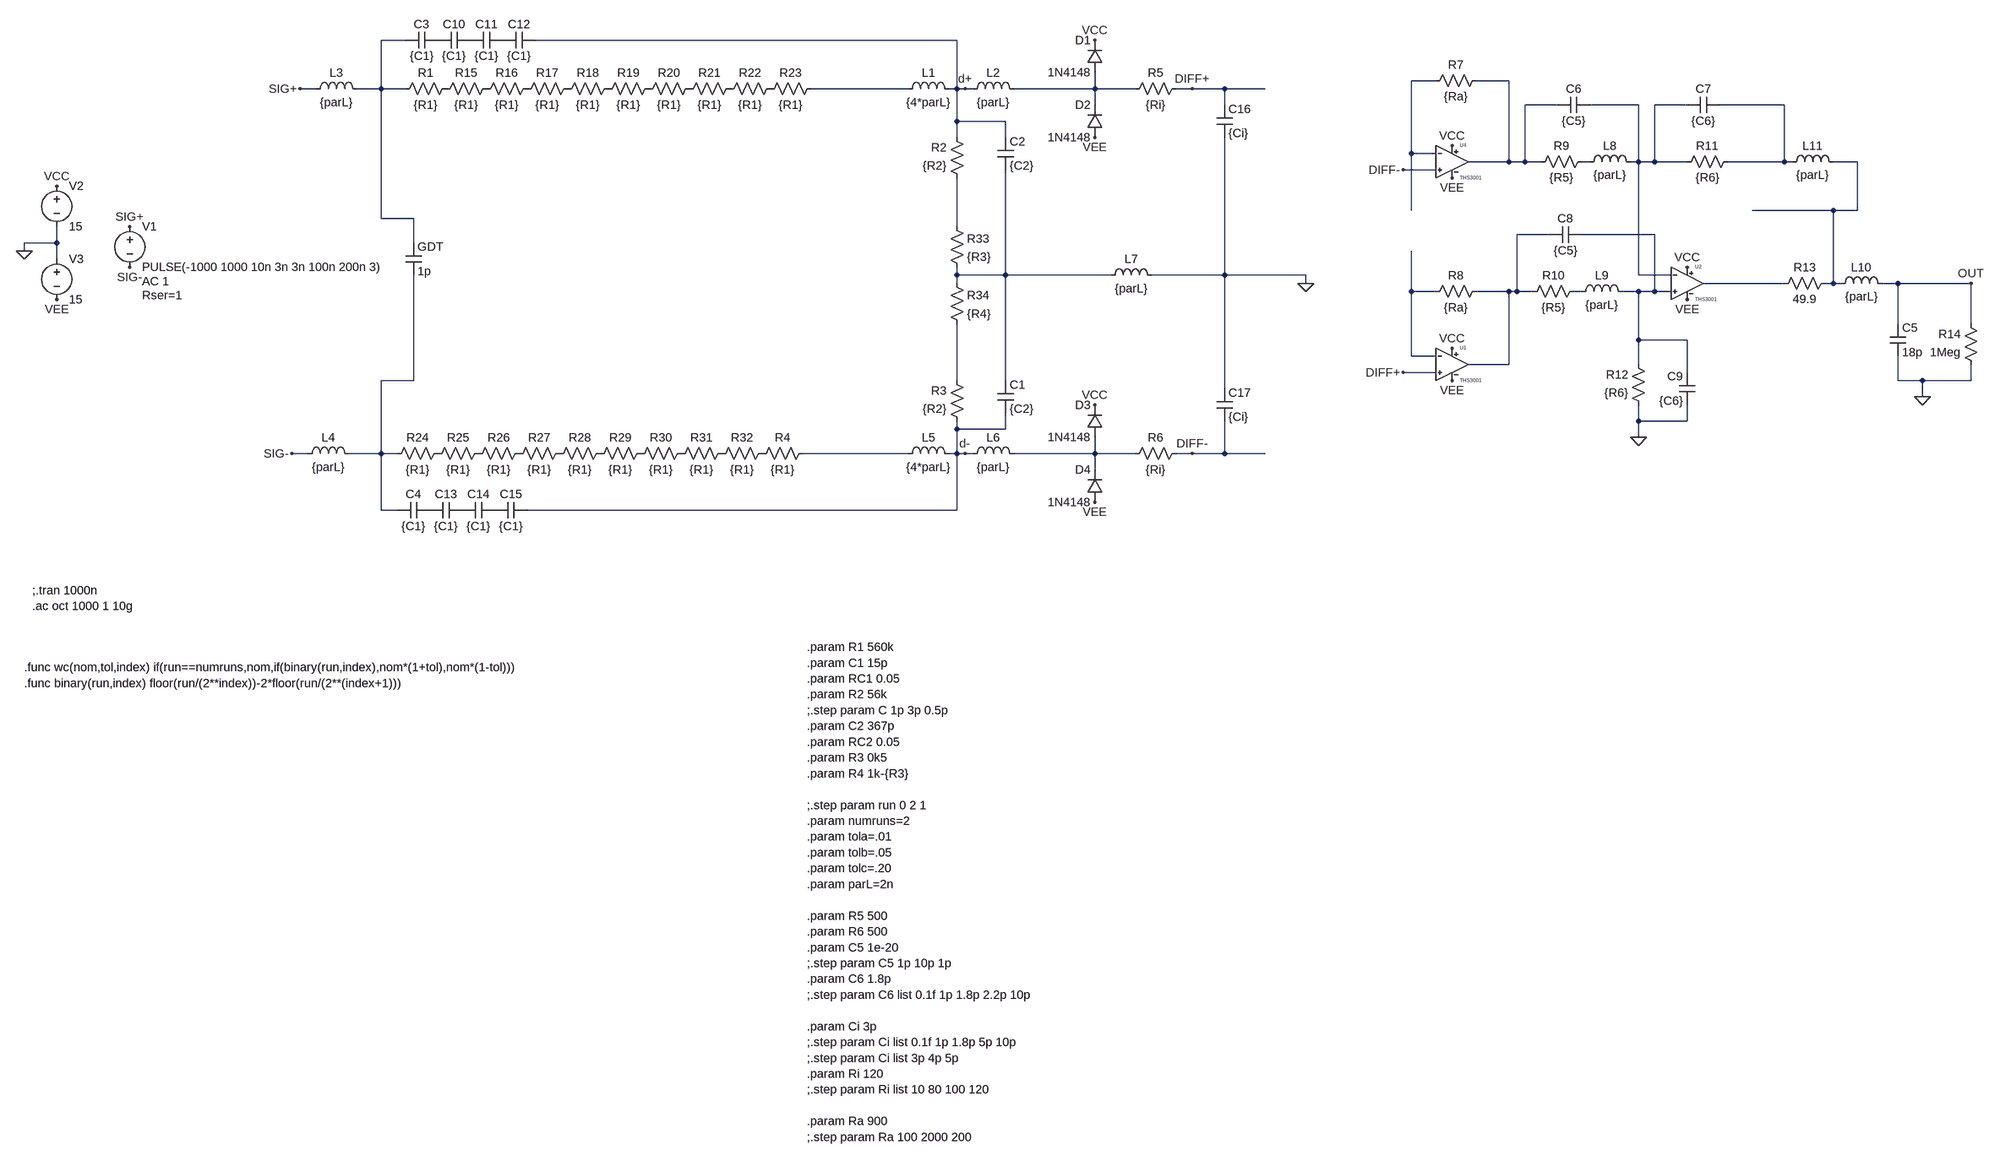
[diagram p0: schematic differential_probe_6_real.asc]
differential_probe_6_real.asc, the LTspice schematic file:
Version 4
SHEET 1 2684 1948
WIRE -912 -144 -960 -144
WIRE 176 -144 -656 -144
WIRE 1584 -64 1536 -64
WIRE 1728 -64 1664 -64
WIRE -1088 -48 -1120 -48
WIRE -960 -48 -960 -144
WIRE -960 -48 -1008 -48
WIRE -912 -48 -960 -48
WIRE 80 -48 -112 -48
WIRE 176 -48 176 -144
WIRE 176 -48 160 -48
WIRE 192 -48 176 -48
WIRE 208 -48 192 -48
WIRE 448 -48 448 -80
WIRE 448 -48 288 -48
WIRE 528 -48 448 -48
WIRE 640 -48 608 -48
WIRE 704 -48 640 -48
WIRE 784 -48 704 -48
WIRE 448 -16 448 -48
WIRE 704 -16 704 -48
WIRE 1824 -16 1760 -16
WIRE 1984 -16 1888 -16
WIRE 2080 -16 2016 -16
WIRE 2272 -16 2144 -16
WIRE 176 16 176 -48
WIRE 272 16 176 16
WIRE 176 48 176 16
WIRE 272 48 272 16
WIRE 1536 80 1536 -64
WIRE 1584 80 1536 80
WIRE 1728 96 1728 -64
WIRE 1728 96 1648 96
WIRE 1760 96 1760 -16
WIRE 1760 96 1728 96
WIRE 1792 96 1760 96
WIRE 1888 96 1872 96
WIRE 1984 96 1984 -16
WIRE 1984 96 1968 96
WIRE 2016 96 2016 -16
WIRE 2016 96 1984 96
WIRE 2080 96 2016 96
WIRE 2272 96 2272 -16
WIRE 2272 96 2160 96
WIRE 2288 96 2272 96
WIRE 2416 96 2368 96
WIRE 1584 112 1520 112
WIRE 1536 192 1536 80
WIRE 2368 192 2208 192
WIRE 2416 192 2416 96
WIRE 2416 192 2368 192
WIRE -960 208 -960 -48
WIRE -896 208 -960 208
WIRE 176 224 176 128
WIRE 1808 240 1744 240
WIRE 2016 240 1872 240
WIRE -1600 256 -1600 224
WIRE -1600 256 -1664 256
WIRE -896 256 -896 208
WIRE -1664 272 -1664 256
WIRE -1600 288 -1600 256
WIRE 176 320 176 304
WIRE 272 320 272 112
WIRE 272 320 176 320
WIRE 480 320 272 320
WIRE 704 320 704 48
WIRE 704 320 560 320
WIRE 864 320 704 320
WIRE 1984 320 1984 96
WIRE 2048 320 1984 320
WIRE 176 336 176 320
WIRE 864 336 864 320
WIRE 2272 336 2112 336
WIRE 2368 336 2368 192
WIRE 2368 336 2352 336
WIRE 2384 336 2368 336
WIRE 2496 336 2464 336
WIRE 2640 336 2496 336
WIRE 1536 352 1536 272
WIRE 1584 352 1536 352
WIRE 1728 352 1664 352
WIRE 1744 352 1744 240
WIRE 1744 352 1728 352
WIRE 1776 352 1744 352
WIRE 1872 352 1856 352
WIRE 1984 352 1952 352
WIRE 2016 352 2016 240
WIRE 2016 352 1984 352
WIRE 2048 352 2016 352
WIRE 2496 416 2496 336
WIRE 2640 416 2640 336
WIRE 1984 448 1984 352
WIRE 2080 448 1984 448
WIRE 1536 480 1536 352
WIRE 1584 480 1536 480
WIRE 1728 496 1728 352
WIRE 1728 496 1648 496
WIRE 1984 496 1984 448
WIRE 1584 512 1520 512
WIRE 2080 512 2080 448
WIRE -896 528 -896 320
WIRE -896 528 -960 528
WIRE 176 528 176 416
WIRE 272 528 272 320
WIRE 2496 528 2496 480
WIRE 2544 528 2496 528
WIRE 2640 528 2640 496
WIRE 2640 528 2544 528
WIRE 704 544 704 320
WIRE 2544 560 2544 528
WIRE 1984 608 1984 576
WIRE 2080 608 2080 576
WIRE 2080 608 1984 608
WIRE 176 624 176 608
WIRE 272 624 272 592
WIRE 272 624 176 624
WIRE 1984 640 1984 608
WIRE -1104 672 -1136 672
WIRE -960 672 -960 528
WIRE -960 672 -1024 672
WIRE -928 672 -960 672
WIRE 80 672 -128 672
WIRE 176 672 176 624
WIRE 176 672 160 672
WIRE 192 672 176 672
WIRE 208 672 192 672
WIRE 448 672 448 640
WIRE 448 672 288 672
WIRE 528 672 448 672
WIRE 640 672 608 672
WIRE 704 672 704 608
WIRE 704 672 640 672
WIRE 784 672 704 672
WIRE 448 704 448 672
WIRE -960 784 -960 672
WIRE -928 784 -960 784
WIRE 176 784 176 672
WIRE 176 784 -672 784
FLAG 864 336 0
FLAG -1120 -48 SIG+
FLAG -1136 672 SIG-
FLAG 640 -48 DIFF+
FLAG 640 672 DIFF-
FLAG -1456 224 SIG+
FLAG -1456 304 SIG-
FLAG -1664 272 0
FLAG -1600 144 VCC
FLAG -1600 368 VEE
FLAG 1616 64 VCC
FLAG 1616 464 VCC
FLAG 1616 128 VEE
FLAG 1616 528 VEE
FLAG 2080 368 VEE
FLAG 2080 304 VCC
FLAG 1984 640 0
FLAG 2544 560 0
FLAG 2640 336 OUT
FLAG 448 48 VEE
FLAG 448 -144 VCC
FLAG 448 768 VEE
FLAG 448 576 VCC
FLAG 1520 512 DIFF+
FLAG 1520 112 DIFF-
FLAG 192 -48 d+
FLAG 192 672 d-
SYMBOL res -816 -64 R90
WINDOW 0 0 56 VBottom 2
WINDOW 3 32 56 VTop 2
SYMATTR InstName R1
SYMATTR Value {R1}
SYMBOL res 192 144 R180
WINDOW 0 36 76 Left 2
WINDOW 3 36 40 Left 2
SYMATTR InstName R2
SYMATTR Value {R2}
SYMBOL res 192 624 R180
WINDOW 0 36 76 Left 2
WINDOW 3 36 40 Left 2
SYMATTR InstName R3
SYMATTR Value {R2}
SYMBOL cap 256 528 R0
SYMATTR InstName C1
SYMATTR Value {C2}
SYMATTR SpiceLine Rser={RC2}
SYMBOL cap 256 48 R0
SYMATTR InstName C2
SYMATTR Value {C2}
SYMATTR SpiceLine Rser={RC2}
SYMBOL cap -848 -160 R90
WINDOW 0 0 32 VBottom 2
WINDOW 3 32 32 VTop 2
SYMATTR InstName C3
SYMATTR Value {C1}
SYMATTR SpiceLine Rser={RC1}
SYMBOL res 624 -64 R90
WINDOW 0 0 56 VBottom 2
WINDOW 3 32 56 VTop 2
SYMATTR InstName R5
SYMATTR Value {Ri}
SYMBOL res 624 656 R90
WINDOW 0 0 56 VBottom 2
WINDOW 3 32 56 VTop 2
SYMATTR InstName R6
SYMATTR Value {Ri}
SYMBOL voltage -1456 208 R0
WINDOW 123 24 124 Left 2
WINDOW 39 24 152 Left 2
SYMATTR Value2 AC 1
SYMATTR SpiceLine Rser=1
SYMATTR InstName V1
SYMATTR Value PULSE(-1000 1000 10n 3n 3n 100n 200n 3)
SYMBOL voltage -1600 128 R0
WINDOW 123 0 0 Left 0
WINDOW 39 0 0 Left 0
SYMATTR InstName V2
SYMATTR Value 15
SYMBOL voltage -1600 272 R0
WINDOW 123 0 0 Left 0
WINDOW 39 0 0 Left 0
SYMATTR InstName V3
SYMATTR Value 15
SYMBOL res 1680 -80 R90
WINDOW 0 0 56 VBottom 2
WINDOW 3 32 56 VTop 2
SYMATTR InstName R7
SYMATTR Value {Ra}
SYMBOL res 1680 336 R90
WINDOW 0 0 56 VBottom 2
WINDOW 3 32 56 VTop 2
SYMATTR InstName R8
SYMATTR Value {Ra}
SYMBOL res 1888 80 R90
WINDOW 0 0 56 VBottom 2
WINDOW 3 32 56 VTop 2
SYMATTR InstName R9
SYMATTR Value {R5}
SYMBOL res 1872 336 R90
WINDOW 0 0 56 VBottom 2
WINDOW 3 32 56 VTop 2
SYMATTR InstName R10
SYMATTR Value {R5}
SYMBOL res 2176 80 R90
WINDOW 0 0 56 VBottom 2
WINDOW 3 32 56 VTop 2
SYMATTR InstName R11
SYMATTR Value {R6}
SYMBOL res 2000 592 R180
WINDOW 0 36 76 Left 2
WINDOW 3 36 40 Left 2
SYMATTR InstName R12
SYMATTR Value {R6}
SYMBOL res 2368 320 R90
WINDOW 0 0 56 VBottom 2
WINDOW 3 32 56 VTop 2
SYMATTR InstName R13
SYMATTR Value 49.9
SYMBOL res 2656 512 R180
WINDOW 0 36 76 Left 2
WINDOW 3 36 40 Left 2
SYMATTR InstName R14
SYMATTR Value 1Meg
SYMBOL cap 2480 416 R0
SYMATTR InstName C5
SYMATTR Value 18p
SYMBOL diode 464 -80 R180
WINDOW 0 24 64 Left 2
WINDOW 3 24 0 Left 2
SYMATTR InstName D1
SYMATTR Value 1N4148
SYMBOL diode 464 48 R180
WINDOW 0 24 64 Left 2
WINDOW 3 24 0 Left 2
SYMATTR InstName D2
SYMATTR Value 1N4148
SYMBOL diode 464 640 R180
WINDOW 0 24 64 Left 2
WINDOW 3 24 0 Left 2
SYMATTR InstName D3
SYMATTR Value 1N4148
SYMBOL diode 464 768 R180
WINDOW 0 24 64 Left 2
WINDOW 3 24 0 Left 2
SYMATTR InstName D4
SYMATTR Value 1N4148
SYMBOL ind 64 -32 R270
WINDOW 0 32 56 VTop 2
WINDOW 3 5 56 VBottom 2
SYMATTR InstName L1
SYMATTR Value {4*parL}
SYMBOL ind 192 -32 R270
WINDOW 0 32 56 VTop 2
WINDOW 3 5 56 VBottom 2
SYMATTR InstName L2
SYMATTR Value {parL}
SYMBOL ind -1104 -32 R270
WINDOW 0 32 56 VTop 2
WINDOW 3 5 56 VBottom 2
SYMATTR InstName L3
SYMATTR Value {parL}
SYMBOL ind -1120 688 R270
WINDOW 0 32 56 VTop 2
WINDOW 3 5 56 VBottom 2
SYMATTR InstName L4
SYMATTR Value {parL}
SYMBOL ind 64 688 R270
WINDOW 0 32 56 VTop 2
WINDOW 3 5 56 VBottom 2
SYMATTR InstName L5
SYMATTR Value {4*parL}
SYMBOL ind 192 688 R270
WINDOW 0 32 56 VTop 2
WINDOW 3 5 56 VBottom 2
SYMATTR InstName L6
SYMATTR Value {parL}
SYMBOL ind 464 336 R270
WINDOW 0 32 56 VTop 2
WINDOW 3 5 56 VBottom 2
SYMATTR InstName L7
SYMATTR Value {parL}
SYMBOL ind 1872 112 R270
WINDOW 0 32 56 VTop 2
WINDOW 3 5 56 VBottom 2
SYMATTR InstName L8
SYMATTR Value {parL}
SYMBOL ind 1856 368 R270
WINDOW 0 32 56 VTop 2
WINDOW 3 5 56 VBottom 2
SYMATTR InstName L9
SYMATTR Value {parL}
SYMBOL ind 2368 352 R270
WINDOW 0 32 56 VTop 2
WINDOW 3 5 56 VBottom 2
SYMATTR InstName L10
SYMATTR Value {parL}
SYMBOL ind 2272 112 R270
WINDOW 0 32 56 VTop 2
WINDOW 3 5 56 VBottom 2
SYMATTR InstName L11
SYMATTR Value {parL}
SYMBOL cap 1888 -32 R90
WINDOW 0 0 32 VBottom 2
WINDOW 3 32 32 VTop 2
SYMATTR InstName C6
SYMATTR Value {C5}
SYMBOL cap 2144 -32 R90
WINDOW 0 0 32 VBottom 2
WINDOW 3 32 32 VTop 2
SYMATTR InstName C7
SYMATTR Value {C6}
SYMATTR SpiceLine Rser=0.01
SYMBOL cap 1872 224 R90
WINDOW 0 0 32 VBottom 2
WINDOW 3 32 32 VTop 2
SYMATTR InstName C8
SYMATTR Value {C5}
SYMBOL cap 2096 576 R180
WINDOW 0 24 56 Left 2
WINDOW 3 24 8 Left 2
SYMATTR InstName C9
SYMATTR Value {C6}
SYMATTR SpiceLine Rser=0.01
SYMBOL res -736 -64 R90
WINDOW 0 0 56 VBottom 2
WINDOW 3 32 56 VTop 2
SYMATTR InstName R15
SYMATTR Value {R1}
SYMBOL res -656 -64 R90
WINDOW 0 0 56 VBottom 2
WINDOW 3 32 56 VTop 2
SYMATTR InstName R16
SYMATTR Value {R1}
SYMBOL res -576 -64 R90
WINDOW 0 0 56 VBottom 2
WINDOW 3 32 56 VTop 2
SYMATTR InstName R17
SYMATTR Value {R1}
SYMBOL res -496 -64 R90
WINDOW 0 0 56 VBottom 2
WINDOW 3 32 56 VTop 2
SYMATTR InstName R18
SYMATTR Value {R1}
SYMBOL res -416 -64 R90
WINDOW 0 0 56 VBottom 2
WINDOW 3 32 56 VTop 2
SYMATTR InstName R19
SYMATTR Value {R1}
SYMBOL res -336 -64 R90
WINDOW 0 0 56 VBottom 2
WINDOW 3 32 56 VTop 2
SYMATTR InstName R20
SYMATTR Value {R1}
SYMBOL res -256 -64 R90
WINDOW 0 0 56 VBottom 2
WINDOW 3 32 56 VTop 2
SYMATTR InstName R21
SYMATTR Value {R1}
SYMBOL res -176 -64 R90
WINDOW 0 0 56 VBottom 2
WINDOW 3 32 56 VTop 2
SYMATTR InstName R22
SYMATTR Value {R1}
SYMBOL res -96 -64 R90
WINDOW 0 0 56 VBottom 2
WINDOW 3 32 56 VTop 2
SYMATTR InstName R23
SYMATTR Value {R1}
SYMBOL cap -784 -160 R90
WINDOW 0 0 32 VBottom 2
WINDOW 3 32 32 VTop 2
SYMATTR InstName C10
SYMATTR Value {C1}
SYMATTR SpiceLine Rser={RC1}
SYMBOL cap -720 -160 R90
WINDOW 0 0 32 VBottom 2
WINDOW 3 32 32 VTop 2
SYMATTR InstName C11
SYMATTR Value {C1}
SYMATTR SpiceLine Rser={RC1}
SYMBOL cap -656 -160 R90
WINDOW 0 0 32 VBottom 2
WINDOW 3 32 32 VTop 2
SYMATTR InstName C12
SYMATTR Value {C1}
SYMATTR SpiceLine Rser={RC1}
SYMBOL res -832 656 R90
WINDOW 0 0 56 VBottom 2
WINDOW 3 32 56 VTop 2
SYMATTR InstName R24
SYMATTR Value {R1}
SYMBOL res -752 656 R90
WINDOW 0 0 56 VBottom 2
WINDOW 3 32 56 VTop 2
SYMATTR InstName R25
SYMATTR Value {R1}
SYMBOL res -672 656 R90
WINDOW 0 0 56 VBottom 2
WINDOW 3 32 56 VTop 2
SYMATTR InstName R26
SYMATTR Value {R1}
SYMBOL res -592 656 R90
WINDOW 0 0 56 VBottom 2
WINDOW 3 32 56 VTop 2
SYMATTR InstName R27
SYMATTR Value {R1}
SYMBOL res -512 656 R90
WINDOW 0 0 56 VBottom 2
WINDOW 3 32 56 VTop 2
SYMATTR InstName R28
SYMATTR Value {R1}
SYMBOL res -432 656 R90
WINDOW 0 0 56 VBottom 2
WINDOW 3 32 56 VTop 2
SYMATTR InstName R29
SYMATTR Value {R1}
SYMBOL res -352 656 R90
WINDOW 0 0 56 VBottom 2
WINDOW 3 32 56 VTop 2
SYMATTR InstName R30
SYMATTR Value {R1}
SYMBOL res -272 656 R90
WINDOW 0 0 56 VBottom 2
WINDOW 3 32 56 VTop 2
SYMATTR InstName R31
SYMATTR Value {R1}
SYMBOL res -192 656 R90
WINDOW 0 0 56 VBottom 2
WINDOW 3 32 56 VTop 2
SYMATTR InstName R32
SYMATTR Value {R1}
SYMBOL res -112 656 R90
WINDOW 0 0 56 VBottom 2
WINDOW 3 32 56 VTop 2
SYMATTR InstName R4
SYMATTR Value {R1}
SYMBOL cap -864 768 R90
WINDOW 0 0 32 VBottom 2
WINDOW 3 32 32 VTop 2
SYMATTR InstName C4
SYMATTR Value {C1}
SYMATTR SpiceLine Rser={RC1}
SYMBOL cap -800 768 R90
WINDOW 0 0 32 VBottom 2
WINDOW 3 32 32 VTop 2
SYMATTR InstName C13
SYMATTR Value {C1}
SYMATTR SpiceLine Rser={RC1}
SYMBOL cap -736 768 R90
WINDOW 0 0 32 VBottom 2
WINDOW 3 32 32 VTop 2
SYMATTR InstName C14
SYMATTR Value {C1}
SYMATTR SpiceLine Rser={RC1}
SYMBOL cap -672 768 R90
WINDOW 0 0 32 VBottom 2
WINDOW 3 32 32 VTop 2
SYMATTR InstName C15
SYMATTR Value {C1}
SYMATTR SpiceLine Rser={RC1}
SYMBOL res 160 208 R0
SYMATTR InstName R33
SYMATTR Value {R3}
SYMBOL res 160 320 R0
SYMATTR InstName R34
SYMATTR Value {R4}
SYMBOL THS3001 1616 32 R0
SYMATTR InstName U4
SYMBOL THS3001 1616 432 R0
SYMATTR InstName U1
SYMBOL THS3001 2080 272 R0
SYMATTR InstName U2
SYMBOL cap 688 -16 R0
SYMATTR InstName C16
SYMATTR Value {Ci}
SYMBOL cap 688 544 R0
SYMATTR InstName C17
SYMATTR Value {Ci}
SYMBOL cap -912 256 R0
SYMATTR InstName GDT
SYMATTR Value 1p
TEXT -1648 952 Left 2 !;.tran 1000n\n.ac oct 1000 1 10g
TEXT -1664 1104 Left 2 !.func wc(nom,tol,index) if(run==numruns,nom,if(binary(run,index),nom*(1+tol),nom*(1-tol)))\n.func binary(run,index) floor(run/(2**index))-2*floor(run/(2**(index+1)))
TEXT -120 1064 Left 2 !.param R1 560k\n.param C1 15p\n.param RC1 0.05\n.param R2 56k\n;.step param C 1p 3p 0.5p\n.param C2 367p\n.param RC2 0.05\n.param R3 0k5\n.param R4 1k-{R3}\n \n;.step param run 0 2 1\n.param numruns=2\n.param tola=.01\n.param tolb=.05\n.param tolc=.20\n.param parL=2n\n \n.param R5 500\n.param R6 500\n.param C5 1e-20\n;.step param C5 1p 10p 1p\n.param C6 1.8p\n;.step param C6 list 0.1f 1p 1.8p 2.2p 10p\n \n.param Ci 3p \n;.step param Ci list 0.1f 1p 1.8p 5p 10p\n;.step param Ci list 3p 4p 5p\n.param Ri 120\n;.step param Ri list 10 80 100 120\n \n.param Ra 900\n;.step param Ra 100 2000 200

The netlist it stands for:
* differential_probe_6_real.asc
R1 P001 N001 {R1}
R2 N010 d+ {R2}
R3 d- N018 {R2}
C1 N013 d- {C2} Rser={RC2}
C2 d+ N013 {C2} Rser={RC2}
C3 P002 N001 {C1} Rser={RC1}
R5 DIFF+ N005 {Ri}
R6 DIFF- N020 {Ri}
V1 SIG+ SIG- PULSE(-1000 1000 10n 3n 3n 100n 200n 3) AC 1 Rser=1
V2 VCC 0 15
V3 0 VEE 15
R7 N003 N002 {Ra}
R8 N011 N015 {Ra}
R9 N008 N003 {R5}
R10 N016 N011 {R5}
R11 N007 N006 {R6}
R12 0 N012 {R6}
R13 N009 N014 49.9
R14 0 OUT 1Meg
C5 OUT 0 18p
D1 N005 VCC 1N4148
D2 VEE N005 1N4148
D3 N020 VCC 1N4148
D4 VEE N020 1N4148
L1 N004 d+ {4*parL}
L2 d+ N005 {parL}
L3 SIG+ N001 {parL}
L4 SIG- N017 {parL}
L5 N019 d- {4*parL}
L6 d- N020 {parL}
L7 N013 0 {parL}
L8 N008 N006 {parL}
L9 N016 N012 {parL}
L10 N009 OUT {parL}
L11 N007 N009 {parL}
C6 N006 N003 {C5}
C7 N007 N006 {C6} Rser=0.01
C8 N012 N011 {C5}
C9 0 N012 {C6} Rser=0.01
R15 P003 P001 {R1}
R16 P004 P003 {R1}
R17 P005 P004 {R1}
R18 P006 P005 {R1}
R19 P007 P006 {R1}
R20 P008 P007 {R1}
R21 P009 P008 {R1}
R22 P010 P009 {R1}
R23 N004 P010 {R1}
C10 P011 P002 {C1} Rser={RC1}
C11 P012 P011 {C1} Rser={RC1}
C12 d+ P012 {C1} Rser={RC1}
R24 P013 N017 {R1}
R25 P014 P013 {R1}
R26 P015 P014 {R1}
R27 P016 P015 {R1}
R28 P017 P016 {R1}
R29 P018 P017 {R1}
R30 P019 P018 {R1}
R31 P020 P019 {R1}
R32 P021 P020 {R1}
R4 N019 P021 {R1}
C4 P022 N017 {C1} Rser={RC1}
C13 P023 P022 {C1} Rser={RC1}
C14 P024 P023 {C1} Rser={RC1}
C15 d- P024 {C1} Rser={RC1}
R33 N010 N013 {R3}
R34 N013 N018 {R4}
XU4 DIFF- N002 VCC VEE N003 THS3001  ; pins IN+ IN- VCC VEE OUT
XU1 DIFF+ N015 VCC VEE N011 THS3001  ; pins IN+ IN- VCC VEE OUT
XU2 N012 N006 VCC VEE N014 THS3001  ; pins IN+ IN- VCC VEE OUT
C16 DIFF+ 0 {Ci}
C17 0 DIFF- {Ci}
C§GDT N001 N017 1p
.model D D
.lib standard.dio
;.tran 1000n
.ac oct 1000 1 10g
.func wc(nom,tol,index) if(run==numruns,nom,if(binary(run,index),nom*(1+tol),nom*(1-tol)))
.func binary(run,index) floor(run/(2**index))-2*floor(run/(2**(index+1)))
.param R1 560k
.param C1 15p
.param RC1 0.05
.param R2 56k
;.step param C 1p 3p 0.5p
.param C2 367p
.param RC2 0.05
.param R3 0k5
.param R4 1k-{R3}
;.step param run 0 2 1
.param numruns=2
.param tola=.01
.param tolb=.05
.param tolc=.20
.param parL=2n
.param R5 500
.param R6 500
.param C5 1e-20
;.step param C5 1p 10p 1p
.param C6 1.8p
;.step param C6 list 0.1f 1p 1.8p 2.2p 10p
.param Ci 3p
;.step param Ci list 0.1f 1p 1.8p 5p 10p
;.step param Ci list 3p 4p 5p
.param Ri 120
;.step param Ri list 10 80 100 120
.param Ra 900
;.step param Ra 100 2000 200
.lib THS3001.lib
.backanno
.end